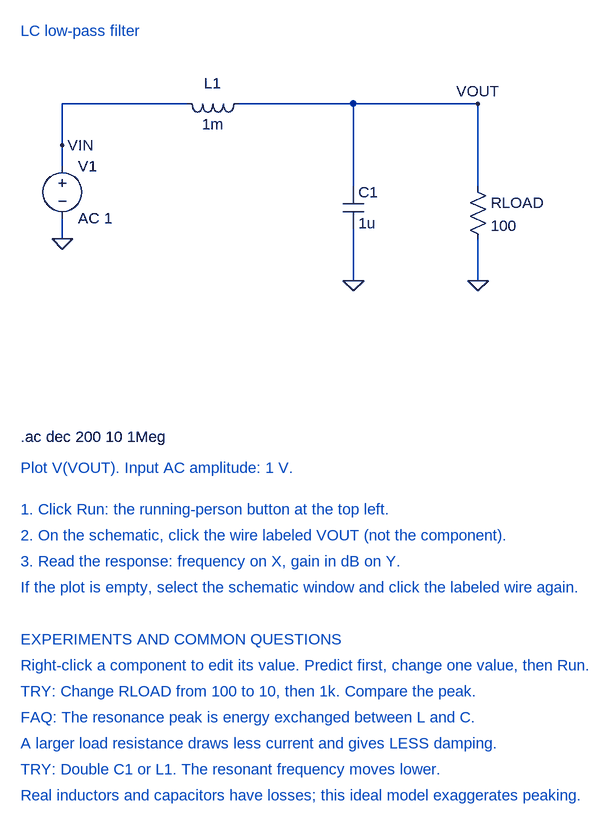
[diagram p0: schematic 03-lc-low-pass.asc]
03-lc-low-pass.asc, the LTspice schematic file:
Version 4
SHEET 1 1200 1400
WIRE 128 208 128 240
WIRE 128 320 128 352
WIRE 128 208 128 144
WIRE 128 144 320 144
WIRE 400 144 768 144
WIRE 576 144 576 272
WIRE 576 336 576 416
WIRE 768 144 768 272
WIRE 768 352 768 416
FLAG 128 208 VIN
FLAG 128 352 0
FLAG 576 416 0
FLAG 768 144 VOUT
FLAG 768 416 0
SYMBOL voltage 128 224 R0
SYMATTR InstName V1
SYMATTR Value AC 1
SYMBOL ind 416 128 R90
WINDOW 0 0 56 VBottom 2
WINDOW 3 32 56 VTop 2
SYMATTR InstName L1
SYMATTR Value 1m
SYMBOL cap 560 272 R0
SYMATTR InstName C1
SYMATTR Value 1u
SYMBOL res 752 256 R0
SYMATTR InstName RLOAD
SYMATTR Value 100
TEXT 64 32 Left 2 ;LC low-pass filter
TEXT 64 656 Left 2 !.ac dec 200 10 1Meg
TEXT 64 704 Left 2 ;Plot V(VOUT). Input AC amplitude: 1 V.
TEXT 64 768 Left 2 ;1. Click Run: the running-person button at the top left.
TEXT 64 808 Left 2 ;2. On the schematic, click the wire labeled VOUT (not the component).
TEXT 64 848 Left 2 ;3. Read the response: frequency on X, gain in dB on Y.
TEXT 64 888 Left 2 ;If the plot is empty, select the schematic window and click the labeled wire again.
TEXT 64 968 Left 2 ;EXPERIMENTS AND COMMON QUESTIONS
TEXT 64 1008 Left 2 ;Right-click a component to edit its value. Predict first, change one value, then Run.
TEXT 64 1048 Left 2 ;TRY: Change RLOAD from 100 to 10, then 1k. Compare the peak.
TEXT 64 1088 Left 2 ;FAQ: The resonance peak is energy exchanged between L and C.
TEXT 64 1128 Left 2 ;A larger load resistance draws less current and gives LESS damping.
TEXT 64 1168 Left 2 ;TRY: Double C1 or L1. The resonant frequency moves lower.
TEXT 64 1208 Left 2 ;Real inductors and capacitors have losses; this ideal model exaggerates peaking.

The netlist it stands for:
* 03-lc-low-pass.asc
V1 VIN 0 AC 1
L1 VOUT VIN 1m
C1 VOUT 0 1u
RLOAD VOUT 0 100
* LC low-pass filter
.ac dec 200 10 1Meg
* Plot V(VOUT). Input AC amplitude: 1 V.
* 1. Click Run: the running-person button at the top left.
* 2. On the schematic, click the wire labeled VOUT (not the component).
* 3. Read the response: frequency on X, gain in dB on Y.
* If the plot is empty, select the schematic window and click the labeled wire again.
* EXPERIMENTS AND COMMON QUESTIONS
* Right-click a component to edit its value. Predict first, change one value, then Run.
* TRY: Change RLOAD from 100 to 10, then 1k. Compare the peak.
* FAQ: The resonance peak is energy exchanged between L and C.
* A larger load resistance draws less current and gives LESS damping.
* TRY: Double C1 or L1. The resonant frequency moves lower.
* Real inductors and capacitors have losses; this ideal model exaggerates peaking.
.backanno
.end